# Altium schematic sheet DC Motor Control.SchDoc
size A4; Engineer: Naif Aljohani; DocumentNumber: 6; Revision: v1.0; SheetNumber: 5; SheetTotal: 7
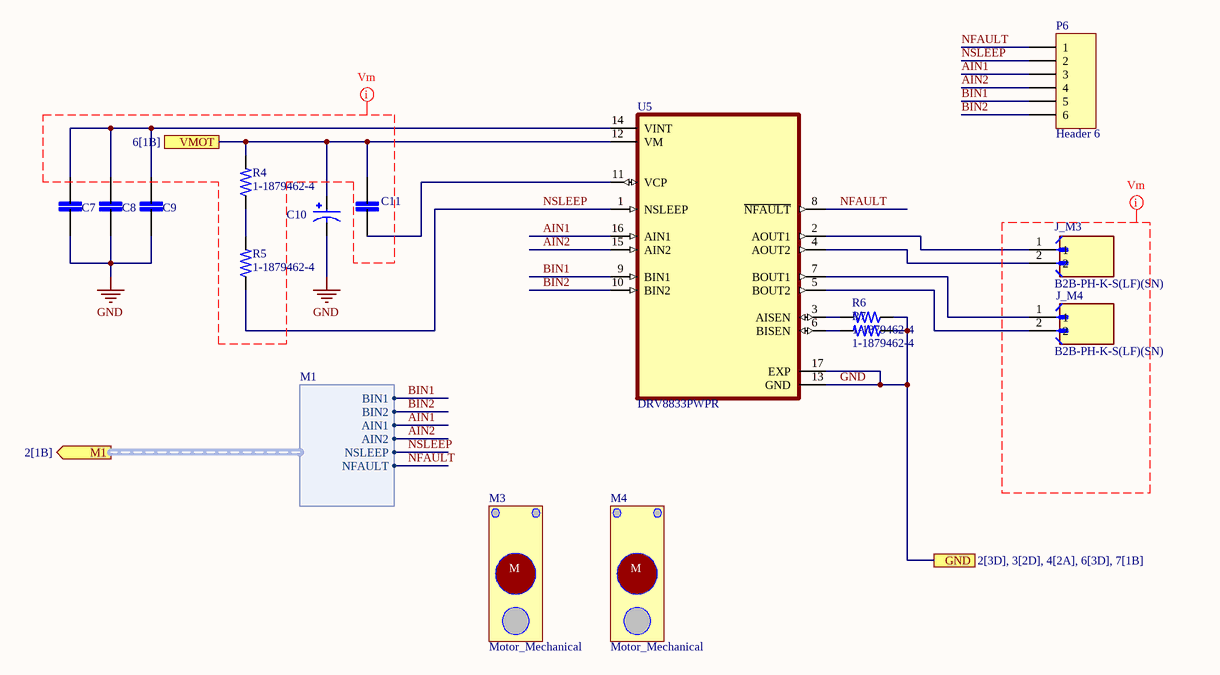
[diagram p0: DC Motor Control.SchDoc]

## Parts
C7  LD051A121KAB2A  [CAPC2012X140N]  (value not drawn)
C8  LD051A121KAB2A  [CAPC2012X140N]  (value not drawn)
C9  LD051A121KAB2A  [CAPC2012X140N]  (value not drawn)
C10  EEEHA1V101UP  [CAP_EEEHA1V101UP]  (value not drawn)
C11  LD051A121KAB2A  [CAPC2012X140N]  (value not drawn)
J_M3  B2B-PH-K-S(LF)(SN)  [JST_B2B-PH-K-S(LF)(SN)]
J_M4  B2B-PH-K-S(LF)(SN)  [JST_B2B-PH-K-S(LF)(SN)]
M3  Motor_Mechanical  [Motor_mechanical]
M4  Motor_Mechanical  [Motor_mechanical]
P6  Header 6  [HDR1X6]
R4  1-1879462-4  [RESC3115X65N]
R5  1-1879462-4  [RESC3115X65N]
R6  1-1879462-4  [RESC3115X65N]
R7  1-1879462-4  [RESC3115X65N]
U5  DRV8833PWPR  [IC_DRV8833PWPR]

## Ports
GND (see 2[3D], 3[2D], 4[2A], 6[3D], 7[1B]), M1 (out, harness M1, see 2[1B]), VMOT (see 6[1B])

## Harnesses
M1: BIN1, BIN2, AIN1, AIN2, NSLEEP, NFAULT

## Nets
GND: C7.2 C8.2 C9.2 C10.2 R6.1 R7.1 U5.13(GND) U5.17(EXP) ; port GND
AIN1: P6.3 U5.16(AIN1) ; port M1.AIN1
AIN2: P6.4 U5.15(AIN2) ; port M1.AIN2
BIN1: P6.5 U5.9(BIN1) ; port M1.BIN1
BIN2: P6.6 U5.10(BIN2) ; port M1.BIN2
NFAULT: P6.1 U5.8(~{NFAULT}) ; port M1.NFAULT
NSLEEP: P6.2 R5.1 U5.1(NSLEEP) ; port M1.NSLEEP
VMOT: C10.1 C11.1 R4.2 U5.12(VM) ; port VMOT
NetC7_1: C7.1 C8.1 C9.1 U5.14(VINT)
NetC11_2: C11.2 U5.11(VCP)
NetJ_M3_1: J_M3.1 U5.2(AOUT1)
NetJ_M3_2: J_M3.2 U5.4(AOUT2)
NetJ_M4_1: J_M4.1 U5.7(BOUT1)
NetJ_M4_2: J_M4.2 U5.5(BOUT2)
NetR4_1: R4.1 R5.2
NetR6_2: R6.2 U5.3(AISEN)
NetR7_2: R7.2 U5.6(BISEN)

## Layout directives
net class Vm; rule Width Constraint [Pref Width = 0.5mm    Min Width = 0.354mm    Max Width = 1mm]: (no net found under the mark)

## Notes on the sheet
- (in symbol Motor_Mechanical) M

## Library data of the parts
C7-C9 C11 = LD051A121KAB2A: 120PF 100V 10% 0805; MF: {'manufacturer': u'AVX'}; Package: None; Price: None; Value: *; MP: LD051A121KAB2A; Availability: Unavailable
C10 = EEEHA1V101UP: MF: {'manufacturer': u'Panasonic'}; Value: *; MP: EEEHA1V101UP; Availability: Unavailable; Package: None; Price: None
J_M3 J_M4 = B2B-PH-K-S(LF)(SN): Connector Header Through Hole 2 position 0.079 (2.00mm); MF: JST; SnapEDA_Link: https://www.snapeda.com/parts/B2B-PH-K-S%20(LF)(SN)/JST/view-part/?ref=snap; Package: None; Value: *; MP: B2B-PH-K-S (LF)(SN); Check_prices: https://www.snapeda.com/parts/B2B-PH-K-S%20(LF)(SN)/JST/view-part/?ref=eda
P6 = Header 6: Header, 6-Pin; LatestRevisionDate: 17-Jul-2002; LatestRevisionNote: Re-released for DXP Platform.; Publisher: Altium Limited
R4-R7 = 1-1879462-4: RL73H 2B R43 1% 5K RL; MF: {'manufacturer': u'TE Connectivity'}; Package: None; Price: None; Value: *; MP: 1-1879462-4; Availability: Unavailable
U5 = DRV8833PWPR: 10.8-V, 2-A dual H-bridge motor driver with current regulation 16-HTSSOP -40 to 85; MF: {'manufacturer': u'Texas Instruments'}; Package: None; Price: None; MP: DRV8833PWPR; Availability: Unavailable; Value: *